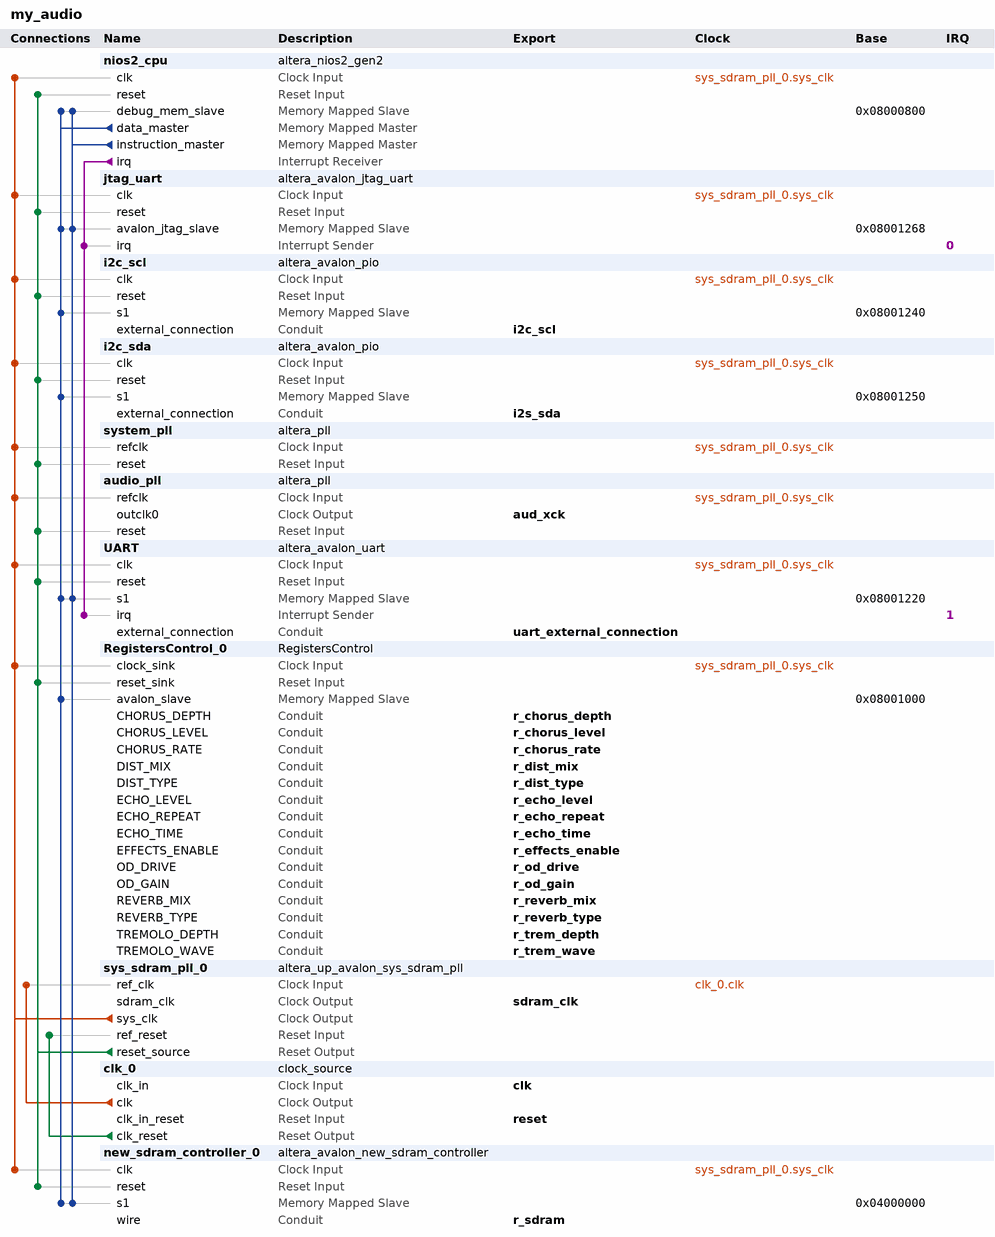
[diagram p0: system contents]
# Platform Designer (Qsys) system my_audio, Cyclone V 5CSEMA5F31C6
# Parameters at their usual value, and those the tool derives, are not listed.
package require -exact qsys 18.1
create_system my_audio
set_project_property DEVICE_FAMILY {Cyclone V}
set_project_property DEVICE 5CSEMA5F31C6

add_instance nios2_cpu altera_nios2_gen2 18.1
set_instance_parameter_value nios2_cpu dcache_size 2048
set_instance_parameter_value nios2_cpu exceptionSlave new_sdram_controller_0.s1
set_instance_parameter_value nios2_cpu icache_size 4096
set_instance_parameter_value nios2_cpu impl Tiny
set_instance_parameter_value nios2_cpu resetSlave new_sdram_controller_0.s1

add_instance jtag_uart altera_avalon_jtag_uart 18.1
set_instance_parameter_value jtag_uart simInteractiveOptions NO_INTERACTIVE_WINDOWS

add_instance i2c_scl altera_avalon_pio 18.1
set_instance_parameter_value i2c_scl direction Output
set_instance_parameter_value i2c_scl width 1

add_instance i2c_sda altera_avalon_pio 18.1
set_instance_parameter_value i2c_sda direction Bidir
set_instance_parameter_value i2c_sda width 1

add_instance system_pll altera_pll 18.1
set_instance_parameter_value system_pll gui_device_speed_grade 1
set_instance_parameter_value system_pll gui_number_of_clocks 1
set_instance_parameter_value system_pll gui_operation_mode direct
set_instance_parameter_value system_pll gui_output_clock_frequency0 10.0
set_instance_parameter_value system_pll gui_pll_mode {Integer-N PLL}
set_instance_parameter_value system_pll gui_reference_clock_frequency 50.0
set_instance_parameter_value system_pll gui_use_locked true

add_instance audio_pll altera_pll 18.1
set_instance_parameter_value audio_pll gui_device_speed_grade 1
set_instance_parameter_value audio_pll gui_number_of_clocks 1
set_instance_parameter_value audio_pll gui_operation_mode direct
set_instance_parameter_value audio_pll gui_output_clock_frequency0 18.432
set_instance_parameter_value audio_pll gui_pll_mode {Fractional-N PLL}
set_instance_parameter_value audio_pll gui_reference_clock_frequency 50.0
set_instance_parameter_value audio_pll gui_use_locked true

add_instance UART altera_avalon_uart 18.1
set_instance_parameter_value UART baud 9600
set_instance_parameter_value UART dataBits 8
set_instance_parameter_value UART fixedBaud false
set_instance_parameter_value UART parity NONE
set_instance_parameter_value UART stopBits 1
set_instance_parameter_value UART useEopRegister true

add_instance RegistersControl_0 RegistersControl 1.0

add_instance sys_sdram_pll_0 altera_up_avalon_sys_sdram_pll 18.0
set_instance_parameter_value sys_sdram_pll_0 CV_boards DE1-SoC
set_instance_parameter_value sys_sdram_pll_0 gui_outclk 50.0
set_instance_parameter_value sys_sdram_pll_0 gui_refclk 50.0

add_instance clk_0 clock_source 18.1
set_instance_parameter_value clk_0 clockFrequency 50000000

add_instance new_sdram_controller_0 altera_avalon_new_sdram_controller 18.1
set_instance_parameter_value new_sdram_controller_0 TAC 5.4
set_instance_parameter_value new_sdram_controller_0 TRCD 15.0
set_instance_parameter_value new_sdram_controller_0 TRP 15.0
set_instance_parameter_value new_sdram_controller_0 casLatency 3
set_instance_parameter_value new_sdram_controller_0 columnWidth 10
set_instance_parameter_value new_sdram_controller_0 dataWidth 16
set_instance_parameter_value new_sdram_controller_0 generateSimulationModel false
set_instance_parameter_value new_sdram_controller_0 model single_Micron_MT48LC4M32B2_7_chip
set_instance_parameter_value new_sdram_controller_0 numberOfBanks 4
set_instance_parameter_value new_sdram_controller_0 numberOfChipSelects 1
set_instance_parameter_value new_sdram_controller_0 powerUpDelay 100.0
set_instance_parameter_value new_sdram_controller_0 refreshPeriod 7.8125
set_instance_parameter_value new_sdram_controller_0 rowWidth 13

# connections
add_connection clk_0.clk sys_sdram_pll_0.ref_clk clock
add_connection sys_sdram_pll_0.sys_clk audio_pll.refclk clock
add_connection sys_sdram_pll_0.sys_clk i2c_scl.clk clock
add_connection sys_sdram_pll_0.sys_clk i2c_sda.clk clock
add_connection sys_sdram_pll_0.sys_clk jtag_uart.clk clock
add_connection sys_sdram_pll_0.sys_clk new_sdram_controller_0.clk clock
add_connection sys_sdram_pll_0.sys_clk nios2_cpu.clk clock
add_connection sys_sdram_pll_0.sys_clk RegistersControl_0.clock_sink clock
add_connection sys_sdram_pll_0.sys_clk system_pll.refclk clock
add_connection sys_sdram_pll_0.sys_clk UART.clk clock
add_connection clk_0.clk_reset sys_sdram_pll_0.ref_reset reset
add_connection sys_sdram_pll_0.reset_source audio_pll.reset reset
add_connection sys_sdram_pll_0.reset_source i2c_scl.reset reset
add_connection sys_sdram_pll_0.reset_source i2c_sda.reset reset
add_connection sys_sdram_pll_0.reset_source jtag_uart.reset reset
add_connection sys_sdram_pll_0.reset_source new_sdram_controller_0.reset reset
add_connection sys_sdram_pll_0.reset_source nios2_cpu.reset reset
add_connection sys_sdram_pll_0.reset_source RegistersControl_0.reset_sink reset
add_connection sys_sdram_pll_0.reset_source system_pll.reset reset
add_connection sys_sdram_pll_0.reset_source UART.reset reset
add_connection nios2_cpu.data_master i2c_scl.s1 avalon
set_connection_parameter_value nios2_cpu.data_master/i2c_scl.s1 baseAddress 0x08001240
add_connection nios2_cpu.data_master i2c_sda.s1 avalon
set_connection_parameter_value nios2_cpu.data_master/i2c_sda.s1 baseAddress 0x08001250
add_connection nios2_cpu.data_master jtag_uart.avalon_jtag_slave avalon
set_connection_parameter_value nios2_cpu.data_master/jtag_uart.avalon_jtag_slave baseAddress 0x08001268
add_connection nios2_cpu.data_master new_sdram_controller_0.s1 avalon
set_connection_parameter_value nios2_cpu.data_master/new_sdram_controller_0.s1 baseAddress 0x04000000
add_connection nios2_cpu.data_master nios2_cpu.debug_mem_slave avalon
set_connection_parameter_value nios2_cpu.data_master/nios2_cpu.debug_mem_slave baseAddress 0x08000800
add_connection nios2_cpu.data_master RegistersControl_0.avalon_slave avalon
set_connection_parameter_value nios2_cpu.data_master/RegistersControl_0.avalon_slave baseAddress 0x08001000
add_connection nios2_cpu.data_master UART.s1 avalon
set_connection_parameter_value nios2_cpu.data_master/UART.s1 baseAddress 0x08001220
add_connection nios2_cpu.instruction_master jtag_uart.avalon_jtag_slave avalon
set_connection_parameter_value nios2_cpu.instruction_master/jtag_uart.avalon_jtag_slave baseAddress 0x08001268
add_connection nios2_cpu.instruction_master new_sdram_controller_0.s1 avalon
set_connection_parameter_value nios2_cpu.instruction_master/new_sdram_controller_0.s1 baseAddress 0x04000000
add_connection nios2_cpu.instruction_master nios2_cpu.debug_mem_slave avalon
set_connection_parameter_value nios2_cpu.instruction_master/nios2_cpu.debug_mem_slave baseAddress 0x08000800
add_connection nios2_cpu.instruction_master UART.s1 avalon
set_connection_parameter_value nios2_cpu.instruction_master/UART.s1 baseAddress 0x08001220
add_connection nios2_cpu.irq jtag_uart.irq interrupt
set_connection_parameter_value nios2_cpu.irq/jtag_uart.irq irqNumber 0
add_connection nios2_cpu.irq UART.irq interrupt
set_connection_parameter_value nios2_cpu.irq/UART.irq irqNumber 1

# exported interfaces
add_interface aud_xck clock source
set_interface_property aud_xck EXPORT_OF audio_pll.outclk0
add_interface clk clock sink
set_interface_property clk EXPORT_OF clk_0.clk_in
add_interface i2c_scl conduit end
set_interface_property i2c_scl EXPORT_OF i2c_scl.external_connection
add_interface i2s_sda conduit end
set_interface_property i2s_sda EXPORT_OF i2c_sda.external_connection
add_interface r_chorus_depth conduit end
set_interface_property r_chorus_depth EXPORT_OF RegistersControl_0.CHORUS_DEPTH
add_interface r_chorus_level conduit end
set_interface_property r_chorus_level EXPORT_OF RegistersControl_0.CHORUS_LEVEL
add_interface r_chorus_rate conduit end
set_interface_property r_chorus_rate EXPORT_OF RegistersControl_0.CHORUS_RATE
add_interface r_dist_mix conduit end
set_interface_property r_dist_mix EXPORT_OF RegistersControl_0.DIST_MIX
add_interface r_dist_type conduit end
set_interface_property r_dist_type EXPORT_OF RegistersControl_0.DIST_TYPE
add_interface r_echo_level conduit end
set_interface_property r_echo_level EXPORT_OF RegistersControl_0.ECHO_LEVEL
add_interface r_echo_repeat conduit end
set_interface_property r_echo_repeat EXPORT_OF RegistersControl_0.ECHO_REPEAT
add_interface r_echo_time conduit end
set_interface_property r_echo_time EXPORT_OF RegistersControl_0.ECHO_TIME
add_interface r_effects_enable conduit end
set_interface_property r_effects_enable EXPORT_OF RegistersControl_0.EFFECTS_ENABLE
add_interface r_od_drive conduit end
set_interface_property r_od_drive EXPORT_OF RegistersControl_0.OD_DRIVE
add_interface r_od_gain conduit end
set_interface_property r_od_gain EXPORT_OF RegistersControl_0.OD_GAIN
add_interface r_reverb_mix conduit end
set_interface_property r_reverb_mix EXPORT_OF RegistersControl_0.REVERB_MIX
add_interface r_reverb_type conduit end
set_interface_property r_reverb_type EXPORT_OF RegistersControl_0.REVERB_TYPE
add_interface r_sdram conduit end
set_interface_property r_sdram EXPORT_OF new_sdram_controller_0.wire
add_interface r_trem_depth conduit end
set_interface_property r_trem_depth EXPORT_OF RegistersControl_0.TREMOLO_DEPTH
add_interface r_trem_wave conduit end
set_interface_property r_trem_wave EXPORT_OF RegistersControl_0.TREMOLO_WAVE
add_interface reset reset sink
set_interface_property reset EXPORT_OF clk_0.clk_in_reset
add_interface sdram_clk clock source
set_interface_property sdram_clk EXPORT_OF sys_sdram_pll_0.sdram_clk
add_interface uart_external_connection conduit end
set_interface_property uart_external_connection EXPORT_OF UART.external_connection

set_interconnect_requirement {$system} qsys_mm.clockCrossingAdapter HANDSHAKE
set_interconnect_requirement {$system} qsys_mm.enableEccProtection FALSE
set_interconnect_requirement {$system} qsys_mm.insertDefaultSlave FALSE
set_interconnect_requirement {$system} qsys_mm.maxAdditionalLatency 1

save_system my_audio.qsys
